# EAGLE schematic LED Power and Digital (EAGLE 9.7.0)
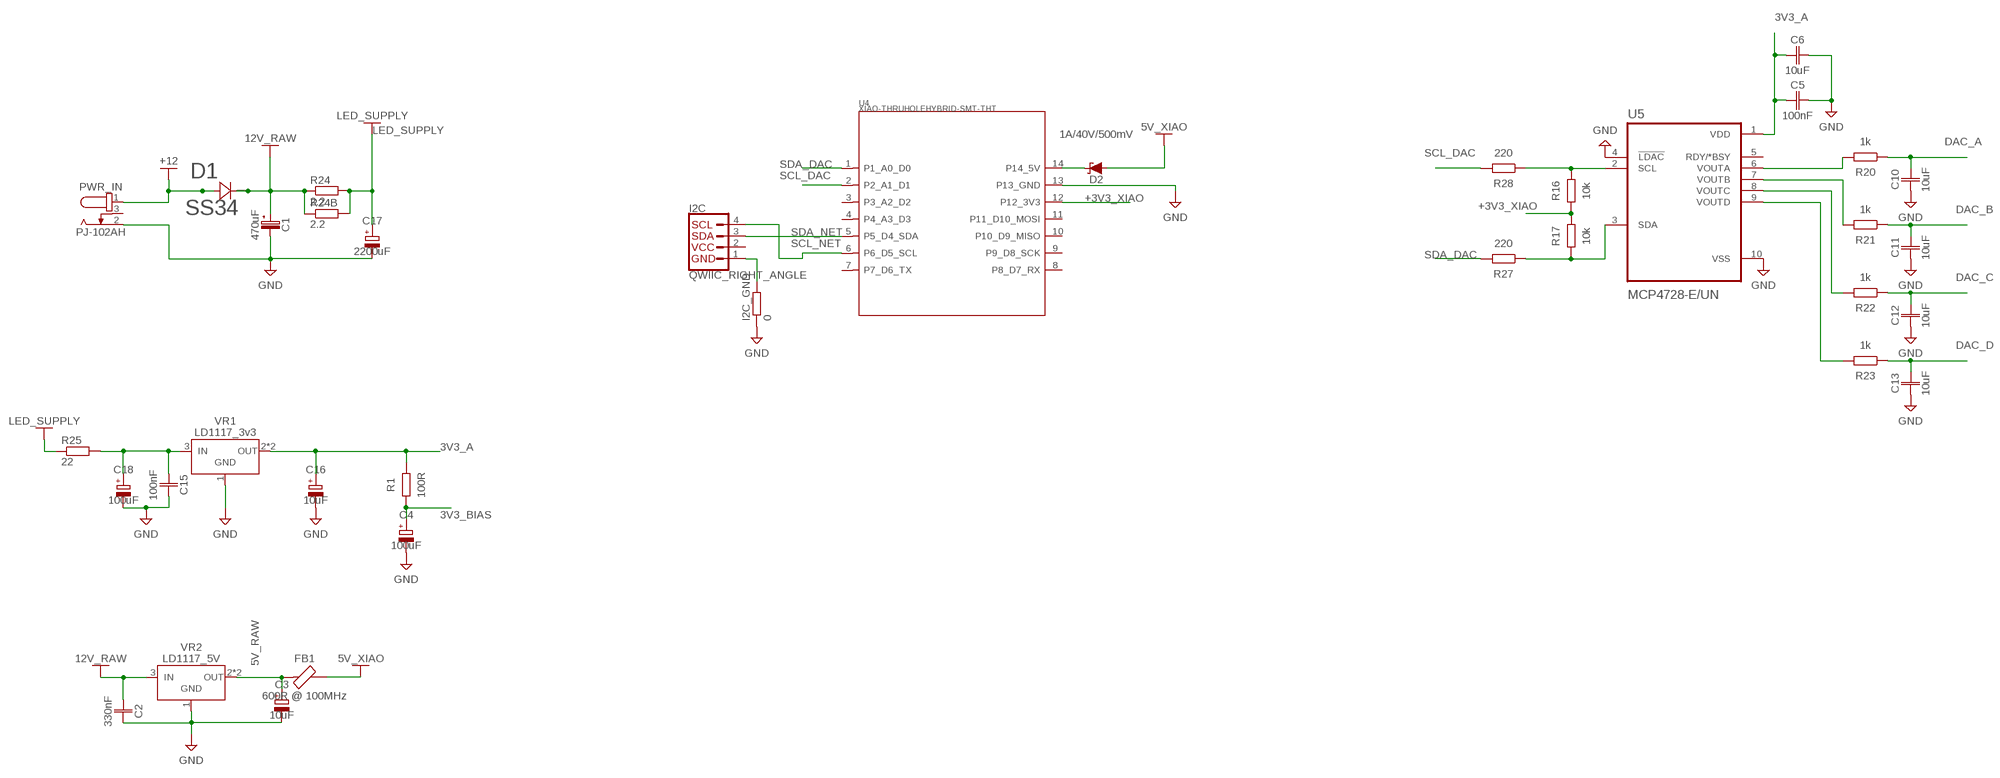
[diagram p0: schematic, sheet 1]

## Parts
C1  470uF  C-POL_ECAP-10.5MM  [CAPAE1030X1050N]
C2  330nF  C_CHIP-0805(2012-METRIC)  [CAPC2012X110]
C3  10uF  CPOL-EUA/3216-18W  [A/3216-18W]
C4  100uF  CPOL-EU153CLV-0605  [153CLV-0605]
C5  100nF  C_CHIP-0805(2012-METRIC)  [CAPC2012X110]
C6  10uF  C_CHIP-1206(3216-METRIC)  [CAPC3216X135]
C10  10uF  C_CHIP-1206(3216-METRIC)  [CAPC3216X135]
C11  10uF  C_CHIP-1206(3216-METRIC)  [CAPC3216X135]
C12  10uF  C_CHIP-1206(3216-METRIC)  [CAPC3216X135]
C13  10uF  C_CHIP-1206(3216-METRIC)  [CAPC3216X135]
C15  100nF  C_CHIP-0805(2012-METRIC)  [CAPC2012X110]
C16  10uF  CPOL-EUA/3216-18W  [A/3216-18W]
C17  2200uF  CPOL-EUE7.5-16  [E7,5-16]
C18  100uF  CPOL-EU153CLV-0605  [153CLV-0605]
D1  SS34  SS34-E3/57TDIODE_DO214AB  [DIODE_DO214AB]
D2  1A/40V/500mV  DIODE-SCHOTTKY-SS14  [SMA-DIODE]
FB1  600R @ 100MHz  FBCHIP-0805(2012-METRIC)  [BEADC2012X105N]
I2C  QWIIC_RIGHT_ANGLE  QWIIC_CONNECTORJS-1MM  [JST04_1MM_RA]
I2C_GND  0  R-EU_R0805  [R0805]
PWR_IN  PJ-102AH  [PJ-102AH]
R1  100R  R_CHIP-1206(3216-METRIC)  [RESC3216X70]
R16  10k  R_CHIP-1206(3216-METRIC)  [RESC3216X70]
R17  10k  R_CHIP-1206(3216-METRIC)  [RESC3216X70]
R20  1k  R_CHIP-1206(3216-METRIC)  [RESC3216X70]
R21  1k  R_CHIP-1206(3216-METRIC)  [RESC3216X70]
R22  1k  R_CHIP-1206(3216-METRIC)  [RESC3216X70]
R23  1k  R_CHIP-1206(3216-METRIC)  [RESC3216X70]
R24  2.2  R-EU_R2512  [R2512]
R24B  2.2  R-EU_R2512  [R2512]
R25  22  R-EU_R0805  [R0805]
R27  220  R_CHIP-1206(3216-METRIC)  [RESC3216X70]
R28  220  R_CHIP-1206(3216-METRIC)  [RESC3216X70]
U4  XIAO-THRUHOLEHYBRID-SMT-THT  [XIAO-GENERIC-HYBRID-MODULE14P-2.54-21X17.8MM]
U5  MCP4728-E/UN  [SOP50P490X110-10N]
VR1  LD1117_3v3  LD1117_SOT223  [SOT230P700X170-4]
VR2  LD1117_5V  LD1117_SOT223  [SOT230P700X170-4]

## Nets
3V3_A: C5.1 C6.1 C16.+ R1.2 U5.1(VDD) VR1.2(VO) VR1.4(VO)
3V3_BIAS: C4.+ R1.1
5V_RAW: C3.+ FB1.1 VR2.2(VO) VR2.4(VO)
5V_XIAO: D2.A FB1.2
12V_RAW: C1.1(+) C2.1 D1.1 R24.1 R24B.1 VR2.3(VI)
+3V3_XIAO: R16.1 R17.2 U4.12(P12_3V3)
+12: D1.2 PWR_IN.1
DAC_A: C10.2 R20.1
DAC_B: C11.2 R21.1
DAC_C: C12.2 R22.1
DAC_D: C13.2 R23.1
GND: C1.2(-) C2.2 C3.- C4.- C5.2 C6.2 C10.1 C11.1 C12.1 C13.1 C15.2 C16.- C17.- C18.- I2C_GND.1 PWR_IN.2 U4.13(P13_GND) U5.4(!LDAC) U5.10(VSS) VR1.1(GND) VR2.1(GND)
LED_SUPPLY: C17.+ R24.2 R24B.2 R25.1
N$1: D2.C U4.14(P14_5V)
N$2: I2C.1 I2C_GND.2
N$3: C15.1 C18.+ R25.2 VR1.3(VI)
N$22: R16.2 R28.1 U5.2(SCL)
N$23: R17.1 R27.1 U5.3(SDA)
N$24: R20.2 U5.6(VOUTA)
N$25: R21.2 U5.7(VOUTB)
N$26: R22.2 U5.8(VOUTC)
N$27: R23.2 U5.9(VOUTD)
SCL_DAC: R28.2 U4.2(P2_A1_D1)
SCL_NET: I2C.4 U4.6(P6_D5_SCL)
SDA_DAC: R27.2 U4.1(P1_A0_D0)
SDA_NET: I2C.3 U4.5(P5_D4_SDA)
Unconnected: PWR_IN.3 U4.3(P3_A2_D2) U4.4(P4_A3_D3) U4.7(P7_D6_TX) U4.8(P8_D7_RX) U4.9(P9_D8_SCK) U4.10(P10_D9_MISO) U4.11(P11_D10_MOSI) U5.5(RDY/*BSY)

## Power pins joined to a net without a drawn wire
2: I2C.2

## Library data of the parts
C1 = Capacitor:C-POL: Capacitor Polarised - Generic; CATEGORY_L1: Capacitor; CATEGORY_L2: Aluminum Electrolytic Capacitors; CATEGORY_L3: Radial Can; PACKAGE: Surface Mount; PACKAGE_SIZE: 10.5MM
C2 C5 C15 = Capacitor:C: Capacitor - Generic; CATEGORY_L1: Capacitor; CATEGORY_L2: Ceramic Capacitors; CATEGORY_L3: MLCC; PACKAGE: Surface Mount; PACKAGE_SIZE: 0805
C3 C4 C16-C18 = rcl:CPOL-EU: POLARIZED CAPACITOR, European symbol; SPICEPREFIX: C
C6 C10-C13 = Capacitor:C: Capacitor - Generic; CATEGORY_L1: Capacitor; CATEGORY_L2: Ceramic Capacitors; CATEGORY_L3: MLCC; PACKAGE: Surface Mount; PACKAGE_SIZE: 1206
D1 = SS34-E3:SS34-E3/57T; COPYRIGHT: Copyright (C) 2026 Ultra Librarian. All rights reserved.; DATASHEET: https://www.vishay.com/doc?88751; DESCRIPTION: 3A, 40V SMC SKY RECT.; MANUFACTURER_NAME: Vishay; MANUFACTURER_PART_NUMBER: SS34-E3/57T
D2 = SparkFun-DiscreteSemi:DIODE-SCHOTTKY: Schottky diode A Schottky diode is a semiconductor diode which has a low forward voltage drop and a very fast switching action.; PROD_ID: DIO-08053
FB1 = Filter:FB: Ferrite Bead - Generic; CATEGORY_L1: Ferrite Bead; DESCRIPTION: Generic Ferrite Bead 0805 (2012 Metric); PACKAGE: Surface Mount; PACKAGE_SIZE: 0805
I2C = SparkFun-Connectors:QWIIC_CONNECTOR: SparkFun I2C Standard Qwiic Connector An SMD 1mm pitch JST connector makes it easy and quick (get it? Qwiic?) to connect I2C devices to each other. The Qwiic system <http://www.sparkfun.com/qwiic> enables fast and solderless connection between popular platforms and various sensors and actuators. We carry 200mm <https://www.sparkfun.com/products/14204>, 100mm <https://www.sparkfun.com/products/14205>, 50mm <https://www.sparkfun.com/products/14206>, and breadboard friendly <https://www.sparkfun.com/products/14207> Qwiic cables. We also offer 10 pcs strips <https://www.sparkfun.com/products/14323> the SMD connectors.; PROD_ID: CONN-13694
I2C_GND R24 R24B R25 = rcl:R-EU_: RESISTOR, European symbol; SPICEPREFIX: R
PWR_IN = Connector:PJ-102AH: 2.0 x 6.5 mm, 5.0 A, Horizontal, Through Hole, Tapered Pins, Dc Power Jack Connector; CATEGORY_L1: Connectors; CATEGORY_L2: Power Connectors; CATEGORY_L3: DC Jack Male; DATASHEET: https://www.sameskydevices.com/product/resource/pj-102ah.pdf; DESCRIPTION: Power Barrel Connector Jack 2.00mm ID (0.079") & 5.50mm OD (0.217") Through Hole & Right Angle; MANUFACTURER: Same Sky; MPN: PJ-102AH; OPERATING_TEMPERATURE: -25°C ~ 85°C; PACKAGE: Through Hole; PACKAGE_SIZE: NA; PART_STATUS: Active; PITCH: NA; ROHS: Compliant; SERIES: PJ-102
R1 R16 R17 R20-R23 R27 R28 = Resistor:R: Resistor Fixed - Generic; CATEGORY_L1: Resistors; DESCRIPTION: Chip Resistor 3.20 X 1.60 X 0.70 mm body 1206(3216-METRIC) Package; PACKAGE: Surface Mount; PACKAGE_SIZE: 1206
U4 = Seeed Studio XIAO Series:XIAO-THRUHOLE: Seeed Studio XIAO Series Through-hole Footprint and Symbol Basic through-hole footprint for Seeed XIAO series of boards. The underside surface mount pads are disabled. For through-hole mounting, a pair of 7-pin, 2.54mm pitch headers with 0.64x0.64mm square leads are recommended. The hybrid variant allows the assembler to choose between surface mount and through-hole mounting methods. However, there is a risk of solder leakage and therefore insufficient solder at the joints if soldering using solder paste and stencils, so we advise using this footprint only when the module is intended to be hand soldered. The symbol pin labels are generic. Please refer to the specific board for more information. Seeed Studio XIAO SAMD21 (Seeeduino XIAO) is also available pre-soldered: Seeed Studio XIAO SAMD21 Pre-soldered - Microchip ATSAMD21G18 Arduino Microcontroller with headers Seeed SKU: 102010388 Buy now <https://www.seeedstudio.com/Seeeduino-XIAO-Pre-Soldered-p-4747.html>
U5 = MCP4728-E_UN:MCP4728-E/UN: Check availability <https://pricing.snapeda.com/parts/MCP4728-E/UN/Microchip/view-part?ref=eda>; AVAILABILITY: In Stock; CHECK_PRICES: https://www.snapeda.com/parts/MCP4728-E/UN/Microchip+Technology/view-part/?ref=eda; DESCRIPTION: Microchip 4-channel 12 bit Serial DAC 10-Pin MSOP | Microchip Technology Inc. MCP4728-E/UN; MF: Microchip; MP: MCP4728-E/UN; PACKAGE: MSOP-10 Microchip; PRICE: None; PURCHASE-URL: https://www.snapeda.com/api/url_track_click_mouser/?unipart_id=43468&manufacturer=Microchip&part_name=MCP4728-E/UN&search_term=mcp4728; SNAPEDA_LINK: https://www.snapeda.com/parts/MCP4728-E/UN/Microchip+Technology/view-part/?ref=snap
VR1 VR2 = IC_Power-Management:LD1117: Adjustable and fixed positive voltage regulator Reference Datasheet <https://www.st.com/content/ccc/resource/technical/document/datasheet/99/3b/7d/91/91/51/4b/be/CD00000544.pdf/files/CD00000544.pdf/jcr:content/translations/en.CD00000544.pdf>; CATEGORY_L1: Power Management IC; CATEGORY_L2: Voltage Regulator; CATEGORY_L3: Linear & LDO Regulators; DESCRIPTION: Linear Voltage Regulator IC SOT-223; PACKAGE: Surface Mount; PACKAGE_SIZE: SOT-223; SERIES: LM1117